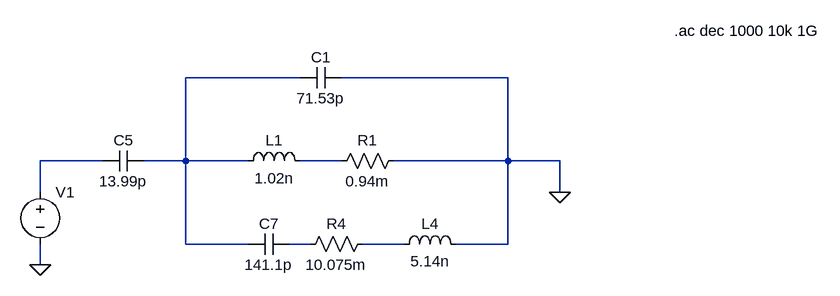
[diagram p0: schematic Parasitic_Cap.asc]
Parasitic_Cap.asc, the LTspice schematic file:
Version 4
SHEET 1 1412 992
WIRE 528 -272 352 -272
WIRE 848 -272 592 -272
WIRE 224 -144 128 -144
WIRE 352 -144 352 -272
WIRE 352 -144 288 -144
WIRE 448 -144 352 -144
WIRE 592 -144 528 -144
WIRE 848 -144 848 -272
WIRE 848 -144 672 -144
WIRE 928 -144 848 -144
WIRE 128 -96 128 -144
WIRE 928 -96 928 -144
WIRE 352 -16 352 -144
WIRE 448 -16 352 -16
WIRE 544 -16 512 -16
WIRE 688 -16 624 -16
WIRE 848 -16 848 -144
WIRE 848 -16 768 -16
WIRE 128 16 128 -16
FLAG 928 -96 0
FLAG 128 16 0
SYMBOL cap 528 -256 R270
WINDOW 0 32 32 VTop 2
WINDOW 3 0 32 VBottom 2
SYMATTR InstName C1
SYMATTR Value 71.53p
SYMBOL cap 288 -160 R90
WINDOW 0 0 32 VBottom 2
WINDOW 3 32 32 VTop 2
SYMATTR InstName C5
SYMATTR Value 13.99p
SYMBOL res 576 -128 R270
WINDOW 0 32 56 VTop 2
WINDOW 3 0 56 VBottom 2
SYMATTR InstName R1
SYMATTR Value 0.94m
SYMBOL ind 432 -128 R270
WINDOW 0 32 56 VTop 2
WINDOW 3 5 56 VBottom 2
SYMATTR InstName L1
SYMATTR Value 1.02n
SYMBOL res 640 -32 R90
WINDOW 0 0 56 VBottom 2
WINDOW 3 32 56 VTop 2
SYMATTR InstName R4
SYMATTR Value 10.075m
SYMBOL ind 672 0 R270
WINDOW 0 32 56 VTop 2
WINDOW 3 5 56 VBottom 2
SYMATTR InstName L4
SYMATTR Value 5.14n
SYMBOL cap 512 -32 R90
WINDOW 0 0 32 VBottom 2
WINDOW 3 32 32 VTop 2
SYMATTR InstName C7
SYMATTR Value 141.1p
SYMBOL voltage 128 -112 R0
WINDOW 3 24 96 Invisible 2
WINDOW 39 0 0 Left 0
SYMATTR Value PULSE(0 72 0 20n 20n 1.666u 5u)
SYMATTR InstName V1
SYMATTR Value2 AC 1
TEXT 1104 -344 Left 2 !.ac dec 1000 10k 1G

The netlist it stands for:
* Parasitic_Cap.asc
C1 N001 0 71.53p
C5 N001 N002 13.99p
R1 N003 0 0.94m
L1 N001 N003 1.02n
R4 N005 N004 10.075m
L4 N005 0 5.14n
C7 N004 N001 141.1p
V1 N002 0 PULSE(0 72 0 20n 20n 1.666u 5u) AC 1
.ac dec 1000 10k 1G
.backanno
.end